# EAGLE schematic QTP-NEUTRIK D-hole (EAGLE 7.4.0)
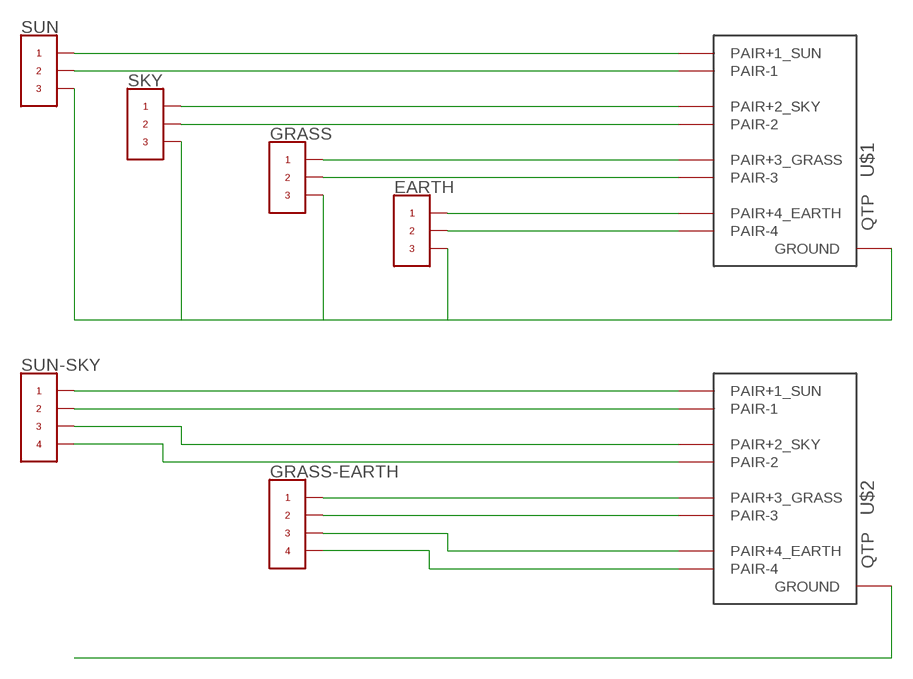
[diagram p0: schematic, sheet 1]

## Parts
EARTH  CON-WBS-LOCKING-0.1-3  [CON-WBS-LOCKING-0.1-3]
GRASS  CON-WBS-LOCKING-0.1-3  [CON-WBS-LOCKING-0.1-3]
GRASS-EARTH  CON-WBS-LOCKING-0.1-4  [CON-WBS-LOCKING-0.1-4]
SKY  CON-WBS-LOCKING-0.1-3  [CON-WBS-LOCKING-0.1-3]
SUN  CON-WBS-LOCKING-0.1-3  [CON-WBS-LOCKING-0.1-3]
SUN-SKY  CON-WBS-LOCKING-0.1-4  [CON-WBS-LOCKING-0.1-4]
U$1  CON-QTP_VERT  [ASSMAN-RJ45_VERT]
U$2  CON-QTP_VERT  [ASSMAN-RJ45_VERT]

## Nets
GND: EARTH.P$3 GRASS.P$3 SKY.P$3 SUN.P$3 U$1.P$9(GROUND) U$1.P$10(GROUND) U$1.P$11(GROUND) U$1.P$12(GROUND) U$2.P$9(GROUND) U$2.P$10(GROUND) U$2.P$11(GROUND) U$2.P$12(GROUND)
N$1: SUN.P$1 U$1.P$2(PAIR+1_SUN)
N$2: SUN.P$2 U$1.P$1(PAIR-1)
N$3: SKY.P$1 U$1.P$4(PAIR+2_SKY)
N$4: SUN-SKY.P$1 U$2.P$2(PAIR+1_SUN)
N$5: GRASS.P$1 U$1.P$6(PAIR+3_GRASS)
N$6: GRASS.P$2 U$1.P$3(PAIR-3)
N$7: EARTH.P$1 U$1.P$8(PAIR+4_EARTH)
N$8: EARTH.P$2 U$1.P$7(PAIR-4)
N$9: SUN-SKY.P$2 U$2.P$1(PAIR-1)
N$10: SUN-SKY.P$3 U$2.P$4(PAIR+2_SKY)
N$11: GRASS-EARTH.P$1 U$2.P$6(PAIR+3_GRASS)
N$12: GRASS-EARTH.P$2 U$2.P$3(PAIR-3)
N$13: GRASS-EARTH.P$3 U$2.P$8(PAIR+4_EARTH)
N$14: GRASS-EARTH.P$4 U$2.P$7(PAIR-4)
SUN_N: SKY.P$2 U$1.P$5(PAIR-2)
SUN_N1: SUN-SKY.P$4 U$2.P$5(PAIR-2)

## Library data of the parts
EARTH GRASS SKY SUN = APK - PARTS:CON-WBS-LOCKING-0.1-3
GRASS-EARTH SUN-SKY = APK - PARTS:CON-WBS-LOCKING-0.1-4
U$1 U$2 = APK - PARTS:CON-QTP_VERT